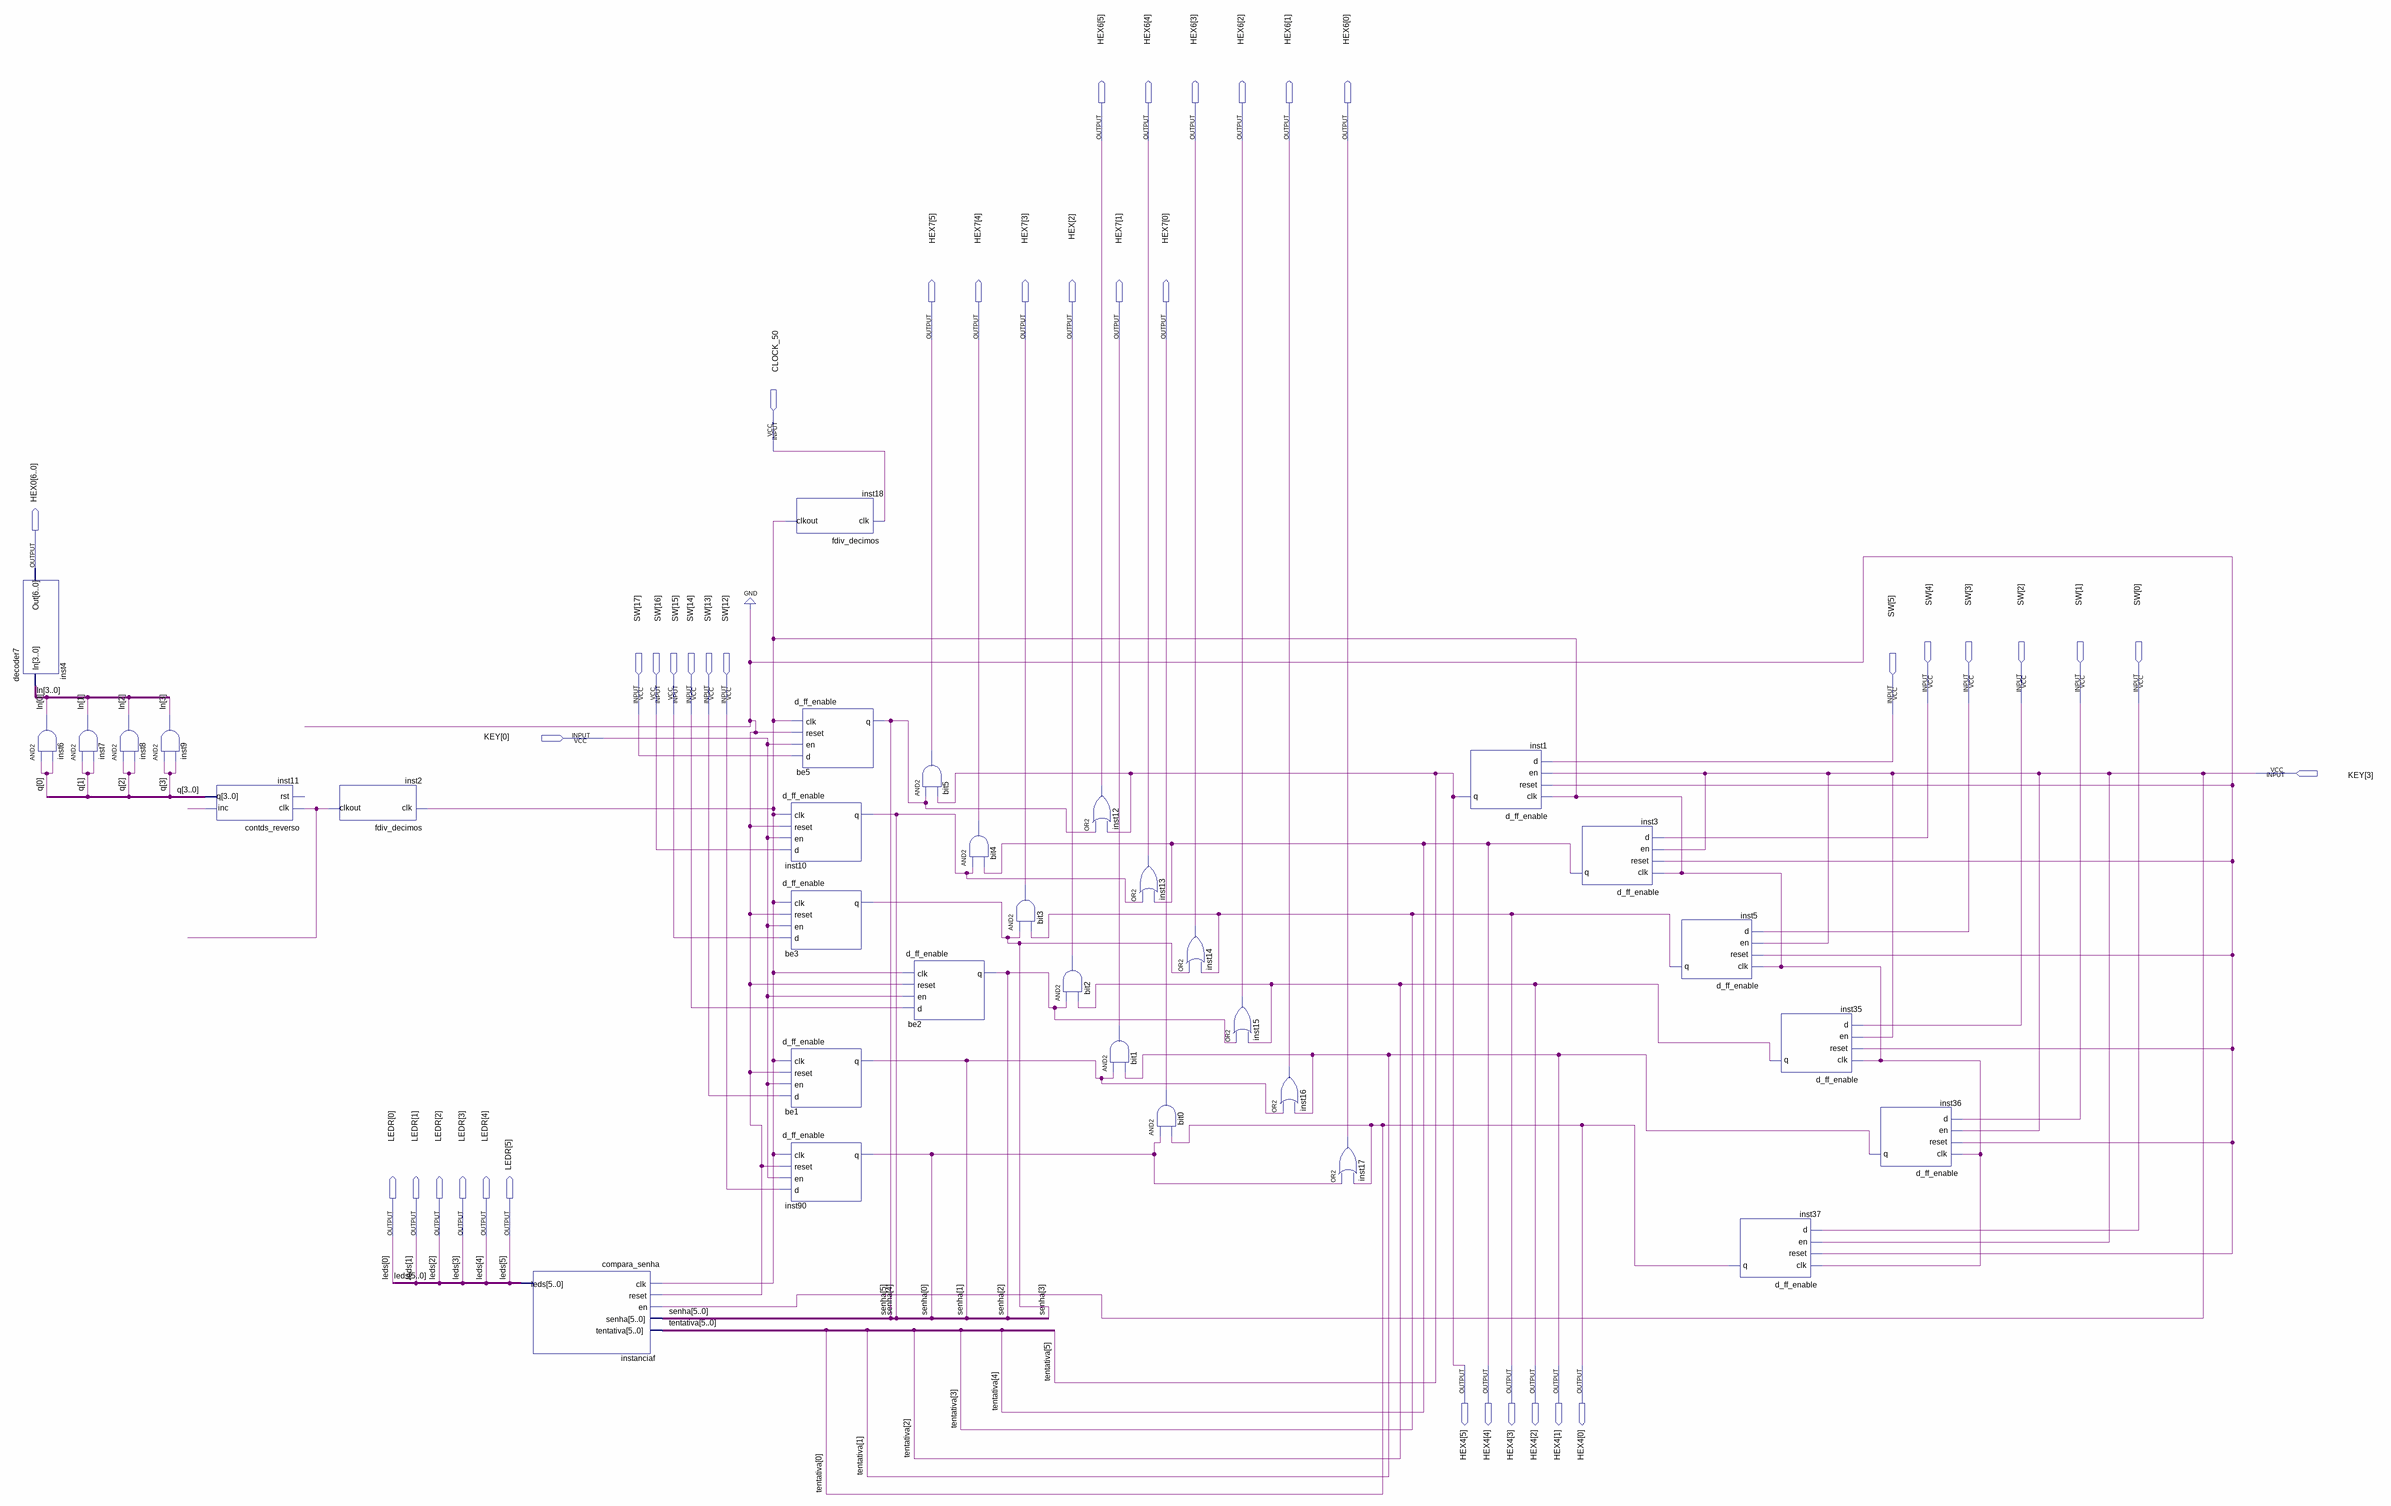
[diagram p0: schematic sheet]
// Quartus schematic PROJETO_COMPLETO.bdf as structural Verilog: 33 symbols, 40 pins
module PROJETO_COMPLETO (
  input  CLOCK_50,
  input  [17:0] SW,
  input  [3:0] KEY,
  output [5:0] HEX6,
  output [5:0] HEX7,
  output [2:2] HEX,
  output [6:0] HEX0,
  output [5:0] LEDR,
  output [5:0] HEX4
);

  wire inst2_clkout, inst11_inc, inst18_clkout;
  wire [3:0] In, q;
  wire [5:0] senha;

  decoder7 inst4 (.In(In), .Out(HEX0));
  and inst6 (In[0], q[0], q[0]);
  and inst7 (In[1], q[1], q[1]);
  and inst8 (In[2], q[2], q[2]);
  and inst9 (In[3], q[3], q[3]);
  contds_reverso inst11 (.clk(inst2_clkout), .inc(inst11_inc), .q(q));  // open: rst
  fdiv_decimos inst2 (.clk(inst18_clkout), .clkout(inst2_clkout));
  compara_senha instanciaf (
    .clk(inst18_clkout), .reset(1'b0), .en(KEY[3]), .senha(senha), .tentativa(HEX4), .leds(LEDR));
  fdiv_decimos inst18 (.clk(CLOCK_50), .clkout(inst18_clkout));
  d_ff_enable inst10 (.clk(inst18_clkout), .reset(1'b0), .en(KEY[0]), .d(SW[16]), .q(senha[4]));
  d_ff_enable be3 (.clk(inst18_clkout), .reset(1'b0), .en(KEY[0]), .d(SW[15]), .q(senha[3]));
  d_ff_enable be1 (.clk(inst18_clkout), .reset(1'b0), .en(KEY[0]), .d(SW[13]), .q(senha[1]));
  d_ff_enable inst90 (.clk(inst18_clkout), .reset(1'b0), .en(KEY[0]), .d(SW[12]), .q(senha[0]));
  d_ff_enable be5 (.clk(inst18_clkout), .reset(1'b0), .en(KEY[0]), .d(SW[17]), .q(senha[5]));
  and bit5 (HEX7[5], senha[5], HEX4[5]);
  d_ff_enable be2 (.clk(inst18_clkout), .reset(1'b0), .en(KEY[0]), .d(SW[14]), .q(senha[2]));
  and bit4 (HEX7[4], senha[4], HEX4[4]);
  and bit3 (HEX7[3], senha[3], HEX4[3]);
  and bit2 (HEX[2], senha[2], HEX4[2]);
  or inst12 (HEX6[5], senha[5], HEX4[5]);
  and bit1 (HEX7[1], senha[1], HEX4[1]);
  or inst13 (HEX6[4], senha[4], HEX4[4]);
  and bit0 (HEX7[0], senha[0], HEX4[0]);
  or inst14 (HEX6[3], senha[3], HEX4[3]);
  or inst15 (HEX6[2], senha[2], HEX4[2]);
  or inst16 (HEX6[1], senha[1], HEX4[1]);
  or inst17 (HEX6[0], senha[0], HEX4[0]);
  d_ff_enable inst1 (.clk(inst18_clkout), .reset(1'b0), .en(KEY[3]), .d(SW[5]), .q(HEX4[5]));
  d_ff_enable inst3 (.clk(inst18_clkout), .reset(1'b0), .en(KEY[3]), .d(SW[4]), .q(HEX4[4]));
  d_ff_enable inst5 (.clk(inst18_clkout), .reset(1'b0), .en(KEY[3]), .d(SW[3]), .q(HEX4[3]));
  d_ff_enable inst35 (.clk(inst18_clkout), .reset(1'b0), .en(KEY[3]), .d(SW[2]), .q(HEX4[2]));
  d_ff_enable inst37 (.clk(inst18_clkout), .reset(1'b0), .en(KEY[3]), .d(SW[0]), .q(HEX4[0]));
  d_ff_enable inst36 (.clk(inst18_clkout), .reset(1'b0), .en(KEY[3]), .d(SW[1]), .q(HEX4[1]));

  // Other names for the same wires on the sheet: tentativa[5:0] = HEX4; leds[5:0] = LEDR
endmodule
